# EAGLE design tranc_1bs (EAGLE 6.5.0)
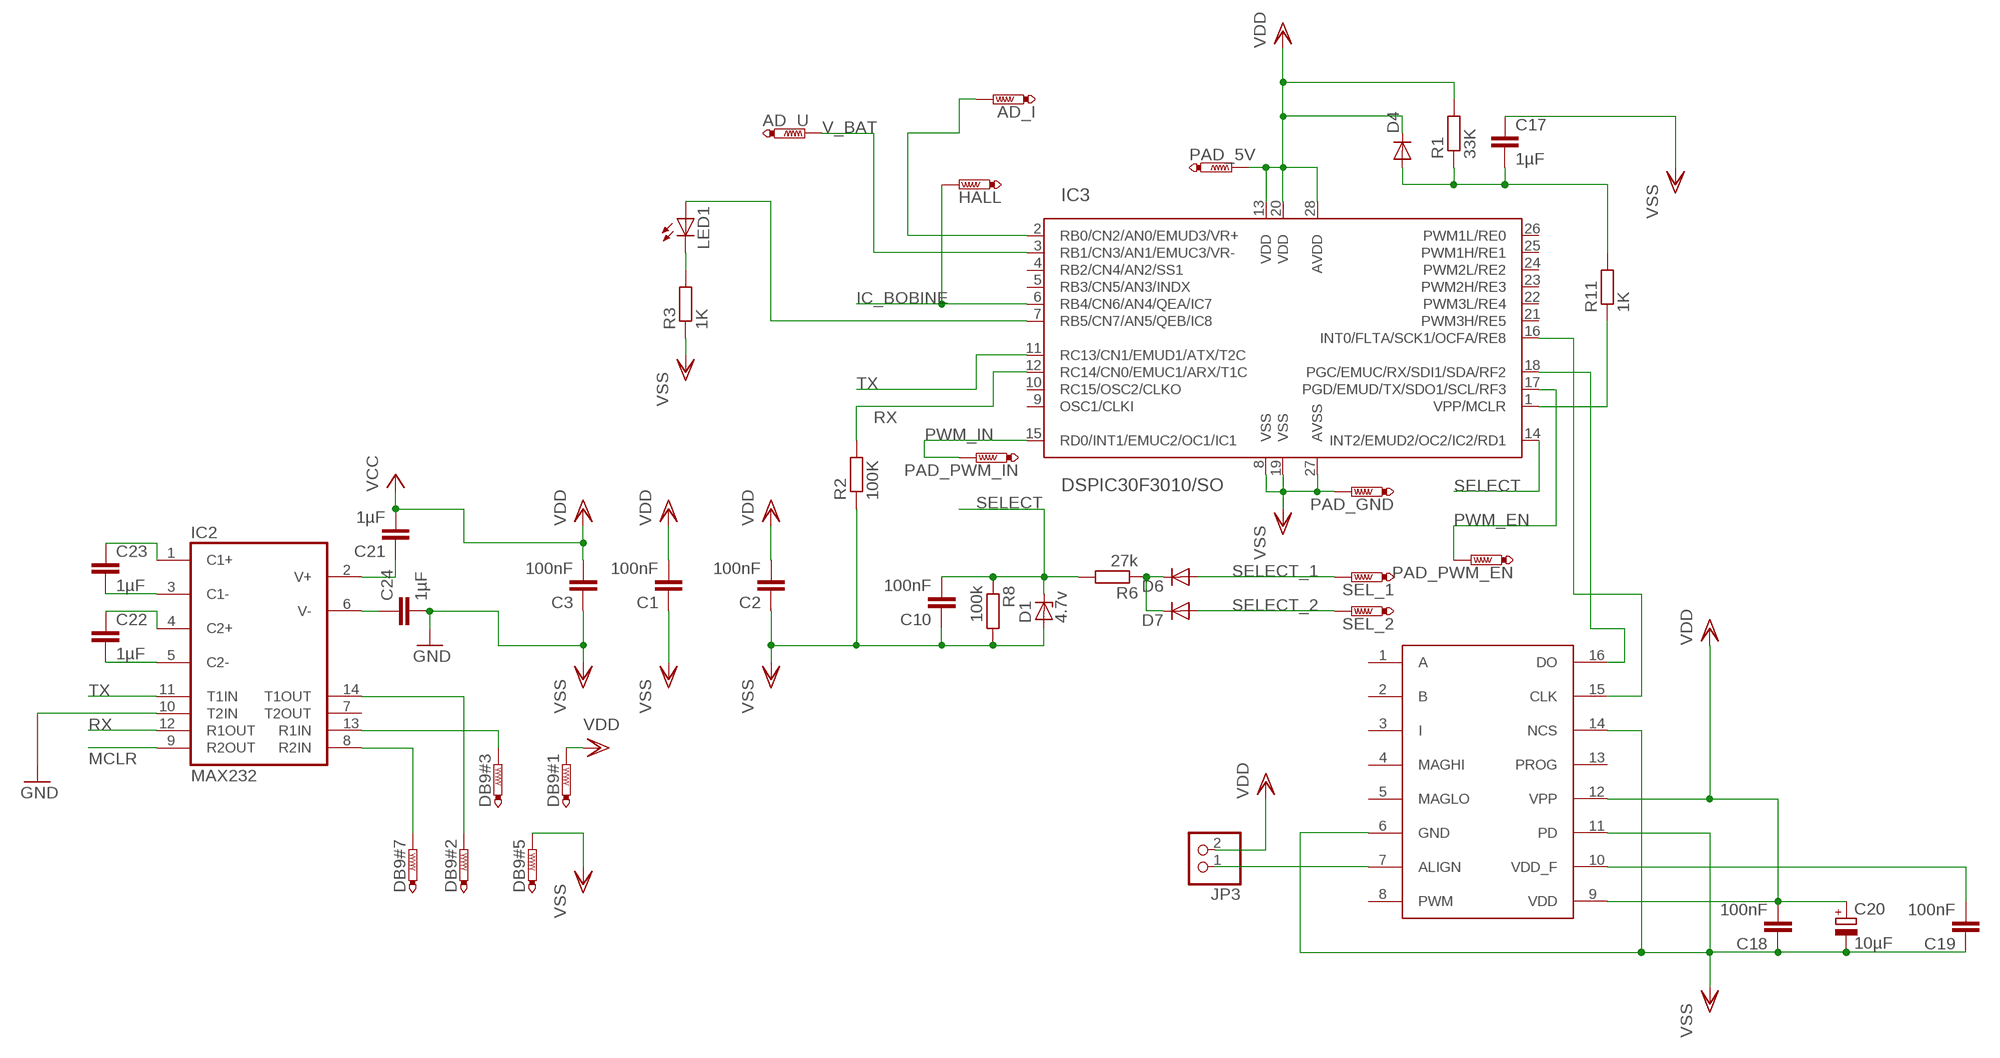
[diagram p0: schematic, sheet 1]

## Parts
AD_I  PTR1TP20SQ  [TP20SQ]
AD_U  PTR1TP20SQ  [TP20SQ]
C1  100nF  C-EUC0805K  [C0805K]
C2  100nF  C-EUC0805K  [C0805K]
C3  100nF  C-EUC0805K  [C0805K]
C10  100nF  C-EUC0805K  [C0805K]
C17  1µF  C-EUC0805K  [C0805K]
C18  100nF  C-EUC0805K  [C0805K]
C19  100nF  C-EUC0805K  [C0805K]
C20  10µF  CPOL-EUSMCB  [SMC_B]
C21  1µF  C-EUC0805K  [C0805K]
C22  1µF  C-EUC0805K  [C0805K]
C23  1µF  C-EUC0805K  [C0805K]
C24  1µF  C-EUC0805K  [C0805K]
D1  4.7v  ZENER-DIODESOD80C  [SOD80C]
D4  DIODE-MINIMELF  [MINIMELF]
D6  DIODE-MINIMELF  [MINIMELF]
D7  DIODE-MINIMELF  [MINIMELF]
DB9#1  PTR1TP20SQ  [TP20SQ]
DB9#2  PTR1TP20SQ  [TP20SQ]
DB9#3  PTR1TP20SQ  [TP20SQ]
DB9#5  PTR1TP20SQ  [TP20SQ]
DB9#7  PTR1TP20SQ  [TP20SQ]
HALL  PTR1TP20SQ  [TP20SQ]
IC2  MAX232  [SO16]
IC3  DSPIC30F3010/SO  [SO-28W]
JP3  PINHD-1X2  [1X02]
LED1  LEDCHIPLED_1206  [CHIPLED_1206]
PAD_5V  PTR1TP20SQ  [TP20SQ]
PAD_GND  PTR1TP20SQ  [TP20SQ]
PAD_PWM_EN  PTR1TP20SQ  [TP20SQ]
PAD_PWM_IN  PTR1TP20SQ  [TP20SQ]
R1  33K  R-EU_M0805  [M0805]
R2  100K  R-EU_M0805  [M0805]
R3  1K  R-EU_M0805  [M0805]
R6  27k  R-EU_M0805  [M0805]
R8  100k  R-EU_M0805  [M0805]
R11  1K  R-EU_M0805  [M0805]
SEL_1  PTR1TP20SQ  [TP20SQ]
SEL_2  PTR1TP20SQ  [TP20SQ]
U$3  AVAGO_AEAT-6600TSSOP16  [AVAGO_TSSOP16]

## Nets
IC_BOBINE: HALL.TP IC3.6(RB4/CN6/AN4/QEA/IC7)
MCLR: IC2.9(R2OUT) IC3.1(VPP/MCLR) R11.1
N$3: IC3.16(INT0/FLTA/SCK1/OCFA/RE8) U$3.15(CLK)
N$6: IC3.7(RB5/CN7/AN5/QEB/IC8) LED1.A
N$9: C17.2 D4.A R1.1 R11.2
N$14: JP3.1 U$3.7(ALIGN)
N$16: D6.C D7.C R6.1
N$17: IC3.18(PGC/EMUC/RX/SDI1/SDA/RF2) U$3.16(DO)
N$23: LED1.C R3.2
N$27: C23.1 IC2.1(C1+)
N$28: C23.2 IC2.3(C1-)
N$29: C22.2 IC2.5(C2-)
N$30: AD_I.TP IC3.2(RB0/CN2/AN0/EMUD3/VR+)
N$31: C19.2 U$3.10(VDD_F)
N$32: C22.1 IC2.4(C2+)
N$33: C21.1 IC2.2(V+)
N$34: C24.1 IC2.6(V-)
N$35: DB9#3.TP IC2.13(R1IN)
N$36: DB9#2.TP IC2.14(T1OUT)
N$37: DB9#7.TP IC2.8(R2IN)
PWM_EN: IC3.17(PGD/EMUD/TX/SDO1/SCL/RF3) PAD_PWM_EN.TP
PWM_IN: IC3.15(RD0/INT1/EMUC2/OC1/IC1) PAD_PWM_IN.TP
RX: IC2.12(R1OUT) IC3.12(RC14/CN0/EMUC1/ARX/T1C) R2.2
SELECT: C10.2 D1.C IC3.14(INT2/EMUD2/OC2/IC2/RD1) R6.2 R8.1
SELECT_1: D6.A SEL_1.TP
SELECT_2: D7.A SEL_2.TP
TX: IC2.11(T1IN) IC3.11(RC13/CN1/EMUD1/ATX/T2C)
V_BAT: AD_U.TP IC3.3(RB1/CN3/AN1/EMUC3/VR-)
VDD: C1.2 C2.2 C3.2 C18.2 C20.+ C21.2 D4.C DB9#1.TP IC3.13(VDD) IC3.20(VDD) IC3.28(AVDD) JP3.2 PAD_5V.TP R1.2 U$3.9(VDD) U$3.12(VPP) ; supply symbol labelled VCC
VSS: C1.1 C2.1 C3.1 C10.1 C17.1 C18.1 C19.1 C20.- C24.2 D1.A DB9#5.TP IC2.10(T2IN) IC3.8(VSS) IC3.19(VSS) IC3.27(AVSS) PAD_GND.TP R2.1 R3.1 R8.2 U$3.6(GND) U$3.11(PD) U$3.14(NCS) ; supply symbol labelled GND
Unconnected: IC2.7(T2OUT) IC3.4(RB2/CN4/AN2/SS1) IC3.5(RB3/CN5/AN3/INDX) IC3.9(OSC1/CLKI) IC3.10(RC15/OSC2/CLKO) IC3.21(PWM3H/RE5) IC3.22(PWM3L/RE4) IC3.23(PWM2H/RE3) IC3.24(PWM2L/RE2) IC3.25(PWM1H/RE1) IC3.26(PWM1L/RE0) U$3.1(A) U$3.2(B) U$3.3(I) U$3.4(MAGHI) U$3.5(MAGLO) U$3.8(PWM) U$3.13(PROG)

## Power pins joined to a net without a drawn wire
VDD: IC2.16(VCC)
VSS: IC2.15(GND)

## Library data of the parts
AD_I AD_U DB9#1-DB9#3 DB9#5 DB9#7 HALL PAD_5V PAD_GND PAD_PWM_EN PAD_PWM_IN SEL_1 SEL_2 = testpad:PTR1: TEST PIN
C1-C3 C10 C17-C19 C21-C24 = rcl:C-EU: CAPACITOR, European symbol
C20 = rcl:CPOL-EU: POLARIZED CAPACITOR, European symbol
D1 = diode:ZENER-DIODE: Z-Diode
D4 D6 D7 = diode:DIODE-: DIODE
IC2 = maxim:MAX232: RS232 TRANSCEIVER
IC3 = microchip-dspic:DSPIC30F3010: dsPIC Motion Controller DSC
JP3 = pinhead:PINHD-1X2: PIN HEADER
LED1 = led:LED: LED OSRAM: - CHIPLED LG R971, LG N971, LY N971, LG Q971, LY Q971, LO R971, LY R971 LH N974, LH R974 LS Q976, LO Q976, LY Q976 LO Q996 - Hyper CHIPLED LW Q18S LB Q993, LB Q99A, LB R99A - SideLED LS A670, LO A670, LY A670, LG A670, LP A670 LB A673, LV A673, LT A673, LW A673 LH A674 LY A675 LS A676, LA A676, LO A676, LY A676, LW A676 LS A679, LY A679, LG A679 - Hyper Micro SIDELED® LS Y876, LA Y876, LO Y876, LY Y876 LT Y87S - SmartLED LW L88C, LW L88S LB L89C, LB L89S, LG L890 LS L89K, LO L89K, LY L89K LS L896, LA L896, LO L896, LY L896 - TOPLED LS T670, LO T670, LY T670, LG T670, LP T670 LSG T670, LSP T670, LSY T670, LOP T670, LYG T670 LG T671, LOG T671, LSG T671 LB T673, LV T673, LT T673, LW T673 LH T674 LS T676, LA T676, LO T676, LY T676, LB T676, LH T676, LSB T676, LW T676 LB T67C, LV T67C, LT T67C, LS T67K, LO T67K, LY T67K, LW E67C LS E67B, LA E67B, LO E67B, LY E67B, LB E67C, LV E67C, LT E67C LW T67C LS T679, LY T679, LG T679 LS T770, LO T770, LY T770, LG T770, LP T770 LB T773, LV T773, LT T773, LW T773 LH T774 LS E675, LA E675, LY E675, LS T675 LS T776, LA T776, LO T776, LY T776, LB T776 LHGB T686 LT T68C, LB T68C - Hyper Mini TOPLED® LB M676 - Mini TOPLED Santana® LG M470 LS M47K, LO M47K, LY M47K Source: http://www.osram.convergy.de LUXEON: - LUMILED® LXK2-PW12-R00, LXK2-PW12-S00, LXK2-PW14-U00, LXK2-PW14-V00 LXK2-PM12-R00, LXK2-PM12-S00, LXK2-PM14-U00 LXK2-PE12-Q00, LXK2-PE12-R00, LXK2-PE12-S00, LXK2-PE14-T00, LXK2-PE14-U00 LXK2-PB12-K00, LXK2-PB12-L00, LXK2-PB12-M00, LXK2-PB14-N00, LXK2-PB14-P00, LXK2-PB14-Q00 LXK2-PR12-L00, LXK2-PR12-M00, LXK2-PR14-Q00, LXK2-PR14-R00 LXK2-PD12-Q00, LXK2-PD12-R00, LXK2-PD12-S00 LXK2-PH12-R00, LXK2-PH12-S00 LXK2-PL12-P00, LXK2-PL12-Q00, LXK2-PL12-R00 Source: www.luxeon.com KINGBRIGHT: KA-3528ASYC Source: www.kingbright.com
R1-R3 R6 R8 R11 = rcl:R-EU_: RESISTOR, European symbol
U$3 = aeat_6600_1:AVAGO_AEAT-6600

## Board
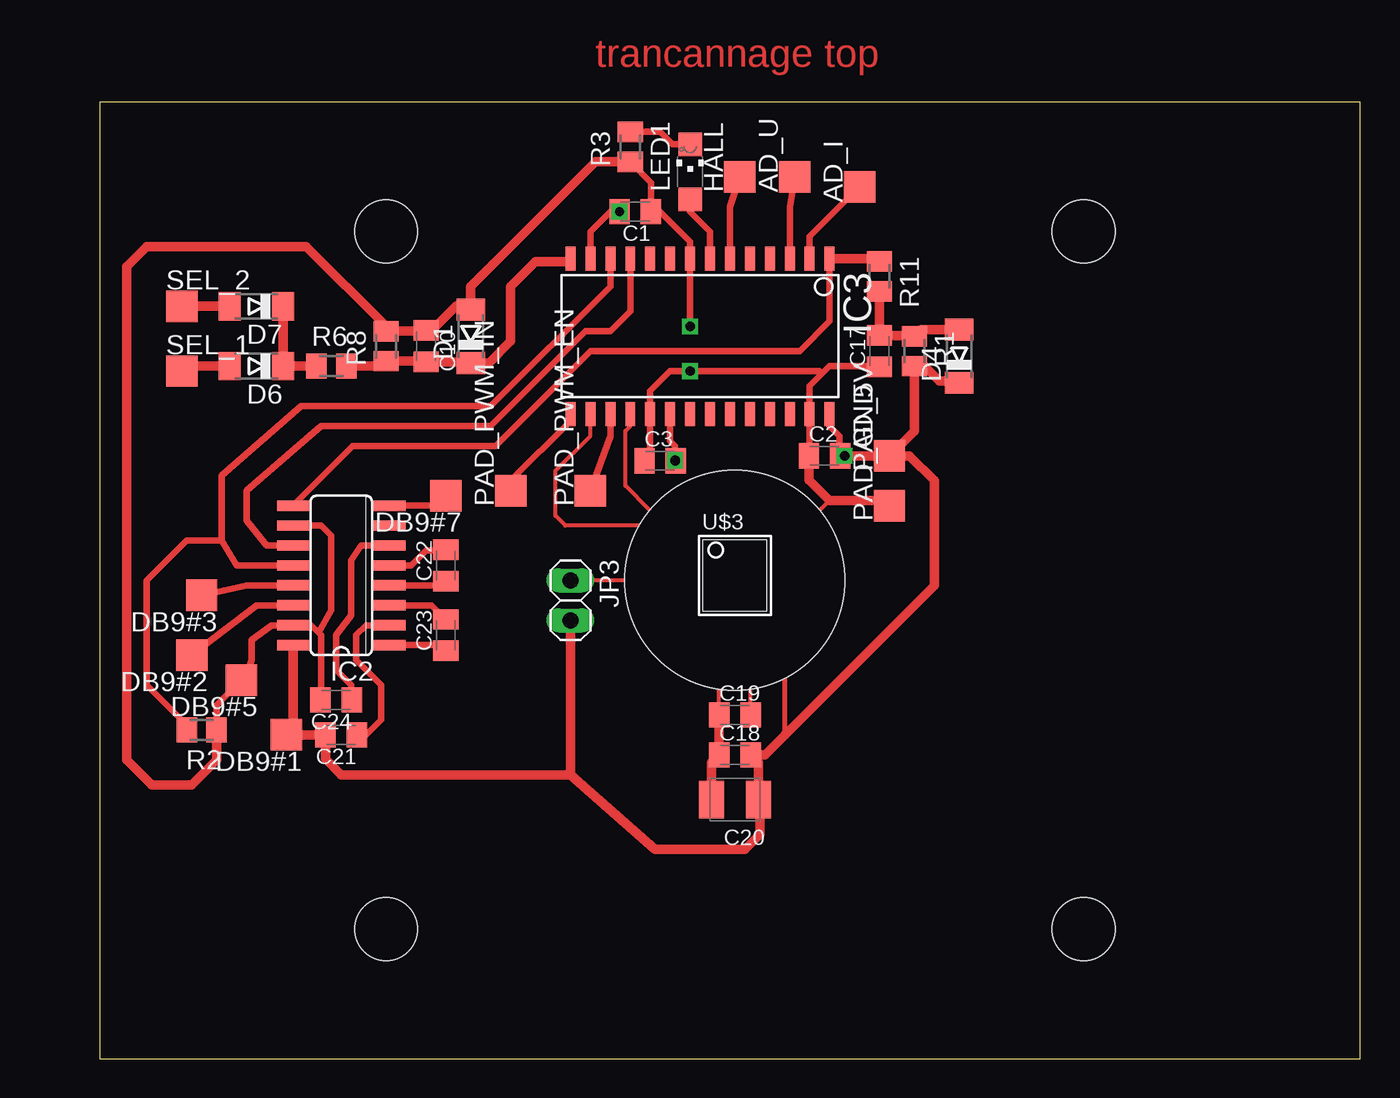
[diagram p1: board, top side]
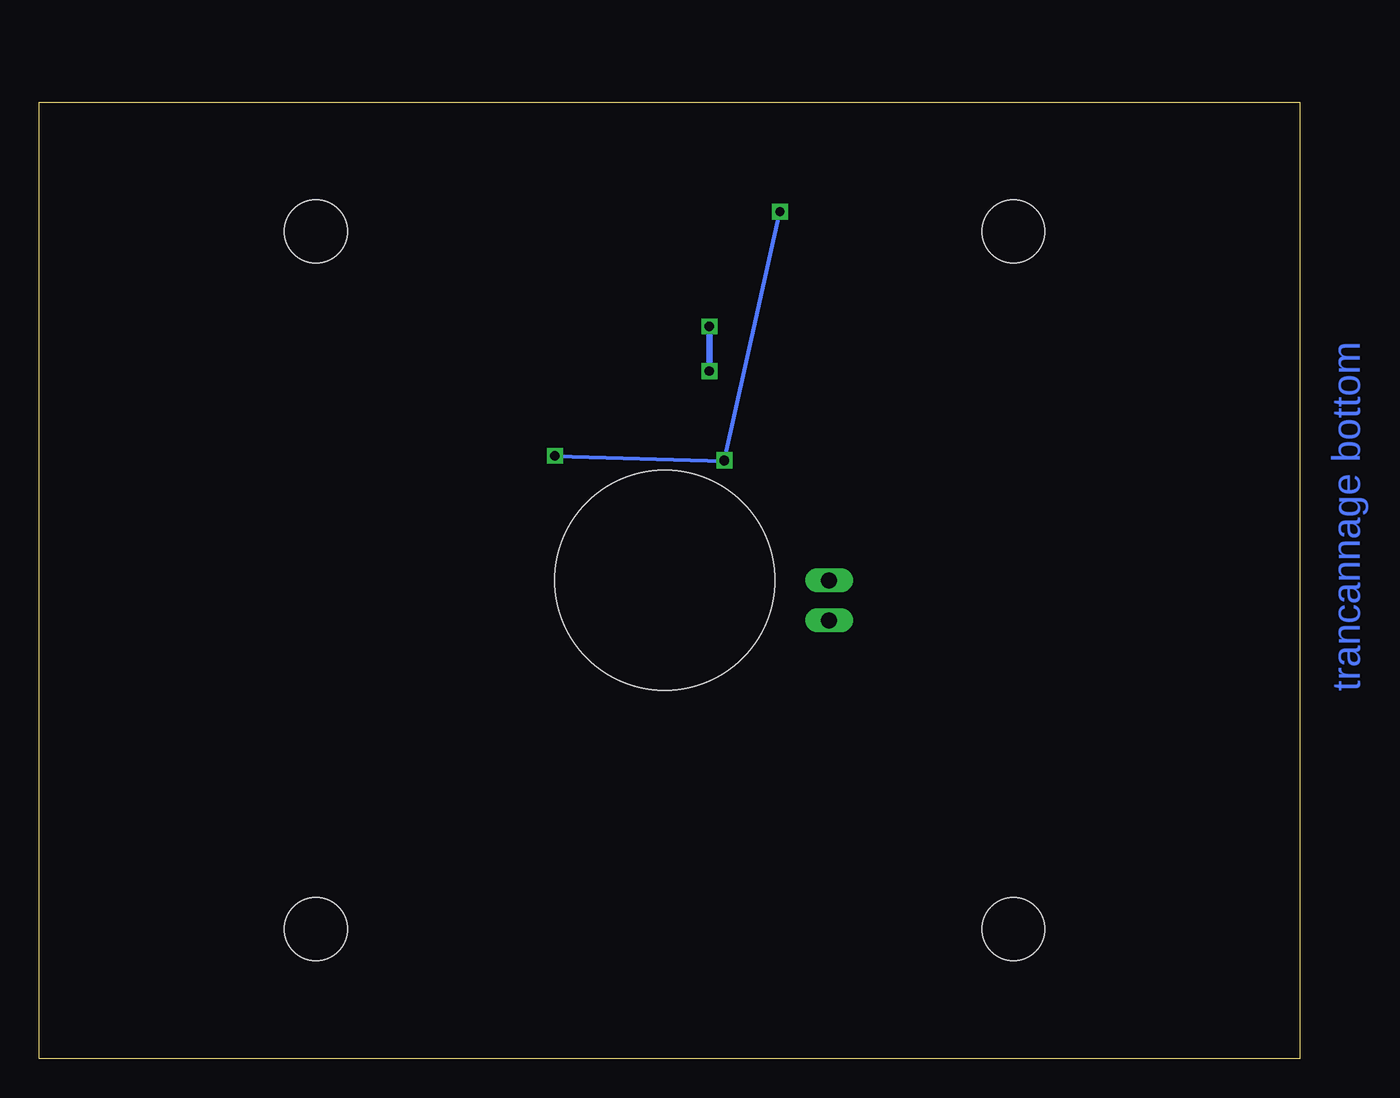
[diagram p2: board, bottom side, seen from below]

Size 80.31 x 60.95 mm. Coordinates in mm from the lower left corner, seen from the top.
Outline: 0,0 80.31,0 80.31,60.95 0,60.95 0,0
Copper layers (1*16): Top 0.035mm / dielectric 1.5mm / Bottom 0.035mm
Design rules "default": minimum track width 10mil, minimum drill 24mil, track to track 8mil, track to pad 8mil, pad to pad 8mil, via to via 8mil, smd to smd 8mil, copper to edge 40mil, drill to drill 8mil, minimum pad ring 10mil, minimum via ring 8mil, stop-mask expansion 4mil, vias tented up to drill 0mil, thermal gap 10mil
Holes 14 mm at 40.48,30.47
Holes 4 mm at 18.25,52.7 62.7,52.7 18.25,8.25 62.7,8.25

### Footprints (pad centres in the part's own frame; a part is rotated, then mirrored left to right if it is on the bottom)
TP20SQ = smd 2 x 2: TP 0,0
C0805K = smd 1.3 x 1.6: 1 -1,0; 2 1,0
SMC_B = smd 1.6 x 2.4: + -1.5,0; - 1.5,0
SOD80C = smd 1.4 x 1.8: A 1.7,0; C -1.7,0
MINIMELF = smd 1.4 x 1.8: A 1.7,0; C -1.7,0
SO16 = smd 0.66 x 2.032: 1 -4.445,-3.073; 2 -3.175,-3.073; 3 -1.905,-3.073; 4 -0.635,-3.073; 5 0.635,-3.073; 6 1.905,-3.073; 7 3.175,-3.073; 8 4.445,-3.073; 9 4.445,3.073; 10 3.175,3.073; 11 1.905,3.073; 12 0.635,3.073; 13 -0.635,3.073; 14 -1.905,3.073; 15 -3.175,3.073; 16 -4.445,3.073
SO-28W = smd 0.635 x 1.524: 1 -7.62,-4.953; 2 -6.35,-4.953; 3 -5.08,-4.953; 4 -3.81,-4.953; 5 -2.54,-4.953; 6 -1.27,-4.953; 7 0,-4.953; 8 1.27,-4.953; 9 2.54,-4.953; 10 3.81,-4.953; 11 5.08,-4.953; 12 6.35,-4.953; 13 7.62,-4.953; 14 8.89,-4.953; 15 8.89,4.953; 16 7.62,4.953; 17 6.35,4.953; 18 5.08,4.953; 19 3.81,4.953; 20 2.54,4.953; 21 1.27,4.953; 22 0,4.953; 23 -1.27,4.953; 24 -2.54,4.953; 25 -3.81,4.953; 26 -5.08,4.953; 27 -6.35,4.953; 28 -7.62,4.953
1X02 = drill 1.016 long: 1 -1.27,0; 2 1.27,0
CHIPLED_1206 = smd 1.5 x 1.5: A 0,-1.75; C 0,1.75
M0805 = smd 1.3 x 1.6: 1 -0.95,0; 2 0.95,0
AVAGO_TSSOP16 = smd 0.305 x 0.991: 1 -2.275,-2.918; 2 -1.625,-2.918; 3 -0.975,-2.918; 4 -0.325,-2.918; 5 0.325,-2.918; 6 0.975,-2.918; 7 1.625,-2.918; 8 2.275,-2.918; 9 2.275,2.918; 10 1.625,2.918; 11 0.975,2.918; 12 0.325,2.918; 13 -0.325,2.918; 14 -0.975,2.918; 15 -1.625,2.918; 16 -2.275,2.918

### Placement (x,y rotation side)
AD_I  48.41,55.56 90 top
AD_U  44.28,56.19 90 top
C1  34.12,53.97 180 top
C2  46.19,38.41 0 top
C3  35.71,38.1 0 top
C10  20.79,45.4 270 top
C17  49.68,45.08 90 top
C18  40.48,19.36 0 top
C19  40.48,21.9 0 top
C20  40.48,16.5 180 top
C21  15.39,20.63 180 top
C22  22.06,31.43 90 top
C23  22.06,26.98 90 top
C24  15.08,22.86 180 top
D1  23.65,46.03 90 top
D4  54.76,44.76 90 top
D6  10,44.13 180 top
D7  10,47.94 180 top
DB9#1  11.9,20.63 180 top
DB9#2  5.87,25.71 180 top
DB9#3  6.5,29.52 180 top
DB9#5  9.04,24.12 180 top
DB9#7  22.06,35.87 180 top
HALL  40.79,56.19 90 top
IC2  15.39,30.79 90 top
IC3  38.89,46.03 180 top
JP3  30,29.2 270 top
LED1  37.62,56.51 0 top
PAD_5V  50.32,38.41 90 top
PAD_GND  50.32,35.24 90 top
PAD_PWM_EN  31.27,36.19 90 top
PAD_PWM_IN  26.19,36.19 90 top
R1  51.91,45.08 270 top
R2  6.5,20.95 180 top
R3  33.81,58.1 90 top
R6  14.76,44.13 0 top
R8  18.25,45.4 90 top
R11  49.68,49.84 270 top
SEL_1  5.23,43.81 0 top
SEL_2  5.23,47.94 0 top
U$3  40.48,30.79 270 top

### Tracks (layer width: path | path; a pad name or v marks a point on that pad's centre or on a via)
IC_BOBINE
  Top 0.406: IC3.6 40.16,54.29 HALL.TP
MCLR
  Top 0.406: IC3.1 46.51,46.98 44.6,45.08 31.27,45.08 25.23,39.05 16.13,39.05 IC2.9
  Top 0.61: IC3.1 49.49,50.98 R11.1
N$3
  Top 0.254: U$3.15 40.75,32.42 39.2,33.97 29.68,33.97 29.04,34.6 29.04,37.46 31.27,39.68 IC3.16
N$6
  Top 0.406: IC3.7 38.89,52.7 37.62,53.97 LED1.A
N$9
  Top 0.61: R11.2 C17.2 51.85,46.08 R1.1 52.34,46.46 D4.A
N$14
  Top 0.254: U$3.7 35.43,29.17 34.12,30.47 JP3.1
N$16
  Top 0.61: D7.C D6.C R6.1
N$17
  Top 0.254: U$3.16 42.64,33.07 40.79,34.92 35.08,34.92 33.49,36.51 33.49,40 33.81,40.32 IC3.18
N$23
  Top 0.406: LED1.C 36.5,58.26 35.71,59.05 R3.2
N$27
  Top 0.406: IC2.1 21.7,26.35 C23.1
N$28
  Top 0.406: IC2.3 21.15,28.89 C23.2
N$29
  Top 0.406: IC2.5 19.84,31.43 20.79,32.38 22.01,32.38 C22.2
N$30
  Top 0.406: IC3.2 45.24,52.38 AD_I.TP
N$31
  Top 0.254: C19.2 41.48,28.62 42.06,29.2 43.35,29.2 U$3.10
N$32
  Top 0.406: IC2.4 21.79,30.16 C22.1
N$33
  Top 0.406: IC2.2 16.98,27.62 16.34,26.98 16.34,25.39 17.93,23.81 17.93,21.58 16.98,20.63 C21.1
N$34
  Top 0.406: IC2.6 16.66,32.7 16.03,31.74 16.03,28.25 15.08,26.98 15.08,24.76 16.03,23.81 16.03,22.9
  Top 0.61: 16.03,22.9 C24.1
N$35
  Top 0.406: DB9#3.TP 9.36,30.16 IC2.13
N$36
  Top 0.406: DB9#2.TP 10,28.89 IC2.14
N$37
  Top 0.406: IC2.8 21.42,35.24 DB9#7.TP
PWM_EN
  Top 0.406: IC3.17 32.54,39.68 PAD_PWM_EN.TP
PWM_IN
  Top 0.406: IC3.15 30,40.64 26.19,36.83 PAD_PWM_IN.TP
RX
  Top 0.406: IC2.12 8.73,31.43 7.77,33.02 | 7.77,33.02 7.77,37.14 12.85,41.59 24.92,41.59 32.54,49.21 IC3.12 | R2.2 5.55,21.27 3.01,23.81 3.01,30.47 5.55,33.02 7.77,33.02
SELECT
  Top 0.61: R6.2 17.93,44.13 R8.1 20.74,44.45 C10.2 23.58,44.4 D1.C 24.8,44.33 26.19,45.72 26.19,49.21 27.77,50.8 29.81,50.8 IC3.14
SELECT_1
  Top 0.61: D6.A 5.55,44.13 SEL_1.TP
SELECT_2
  Top 0.61: D7.A SEL_2.TP
TX
  Top 0.406: IC3.11 33.81,47.62 32.54,46.35 30.95,46.35 24.92,40.32 14.12,40.32 9.36,36.19 9.36,34.29 10.63,32.7 IC2.11
V_BAT
  Top 0.406: IC3.3 43.97,54.29 AD_U.TP
VDD  (via drill 0.6)
  Top 0.254: U$3.9 44.55,28.52 45.24,29.2 45.24,30.16 44.92,30.47 U$3.12 | C3.2 v36.66,38.1
  Top 0.305: 43.65,20.63 43.65,28.26 U$3.9
  Top 0.406: IC3.28 46.51,40.32 47.14,39.68 47.14,38.46 C2.2 | IC3.20 36.35,39.37 36.66,39.05 v36.66,38.14 C3.2 | IC3.13 31.27,52.7 32.54,53.97 C1.2 | 30,18.09 30,26.98
  Top 0.61: IC2.16 12.32,21.05 DB9#1.TP C21.2 14.39,19.09 15.39,18.09 30,18.09 | C2.2 v47.46,38.41 PAD_5V.TP | D4.C 54.65,43.18 53.49,43.18 52.54,44.13 R1.2 51.91,40 PAD_5V.TP | PAD_5V.TP 51.59,38.41 53.17,36.83 53.17,30.16 43.65,20.63 42.38,19.36 C18.2 41.98,18.86 C20.+ 42.06,16.42 42.06,14.28 41.11,13.33 35.39,13.33 30,18.09 | JP3.2 30,18.09
  Bottom 0.254: v36.66,38.14 C1.2 | v47.46,38.41 v36.66,38.1
  other vias: 33.12,53.97
VSS  (via drill 0.6)
  Top 0.254: U$3.6 39.52,29.82 | 39.52,29.82 41.43,29.82 | 41.43,29.82 U$3.11 | 41.43,29.82 41.43,31.11 42.09,31.77 U$3.14 44.94,31.77 45.87,32.7 45.87,34.92 46.51,35.55 | C19.1 39.48,29.77 39.52,29.82
  Top 0.406: 13.96,27.14 13.49,27.62 IC2.15 10.95,27.62 9.68,26.66 9.68,25.39 9.36,24.44 DB9#5.TP 7.45,22.54 R2.1 | 13.96,27.14 14.12,26.98 14.12,22.9 C24.2 | IC2.10 14.12,33.97 14.76,33.33 14.76,28.57 13.96,27.14 | C2.1 45.24,38.46 IC3.27 45.24,42.86 46.03,43.65 | 46.03,43.65 46.51,44.13 49.63,44.13 C17.1 | C3.1 35.08,38.46 IC3.19 35.08,42.54 36.35,43.81 v37.62,43.81 45.87,43.81 46.03,43.65 | R3.1 35.12,55.83 C1.1 35.71,53.97 37.62,52.07 IC3.8 v37.62,46.67
  Top 0.61: C2.1 45.19,36.87 46.51,35.55 50,35.55 PAD_GND.TP | R3.1 31.58,57.15 23.65,49.21 D1.A 23.44,47.94 22.7,47.94 21.15,46.4 C10.1 20.74,46.35 R8.2 18.25,46.67 13.17,51.75 3.01,51.75 1.74,50.48 1.74,19.04 3.33,17.46 5.87,17.46 7.46,19.04 R2.1 | C19.1 C18.1 38.98,18.86 C20.-
  Bottom 0.406: v37.62,43.81 v37.62,46.67

### Text on the board
Top: trancannage top
Bottom: trancannage bottom